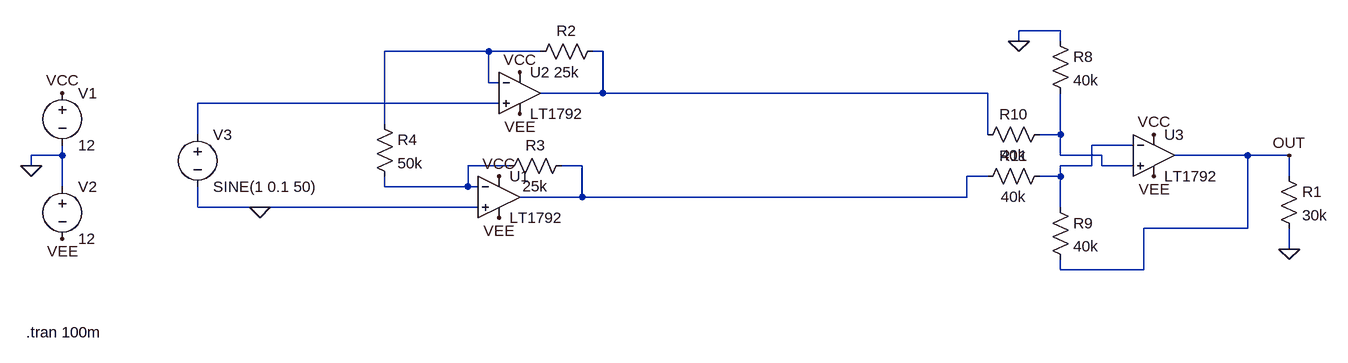
[diagram p0: schematic instrumentation_amplifier.asc]
instrumentation_amplifier.asc, the LTspice schematic file:
Version 4
SHEET 1 1684 680
WIRE 1088 -48 1024 -48
WIRE 1024 -32 1024 -48
WIRE 1088 -32 1088 -48
WIRE 208 -16 48 -16
WIRE 288 -16 208 -16
WIRE 384 -16 368 -16
WIRE 208 32 208 -16
WIRE 224 32 208 32
WIRE 384 48 384 -16
WIRE 384 48 288 48
WIRE 976 48 384 48
WIRE 224 64 -240 64
WIRE 48 96 48 -16
WIRE -240 112 -240 64
WIRE 976 112 976 48
WIRE 1088 112 1088 48
WIRE 1088 112 1056 112
WIRE 1200 128 1136 128
WIRE -448 144 -448 128
WIRE -448 144 -496 144
WIRE 1088 144 1088 112
WIRE 1152 144 1088 144
WIRE 1376 144 1264 144
WIRE 1440 144 1376 144
WIRE -496 160 -496 144
WIRE 240 160 176 160
WIRE 352 160 320 160
WIRE 1136 160 1136 128
WIRE 1136 160 1088 160
WIRE 1152 160 1152 144
WIRE 1200 160 1152 160
WIRE 976 176 944 176
WIRE 1088 176 1088 160
WIRE 1088 176 1056 176
WIRE 1440 176 1440 144
WIRE -448 192 -448 144
WIRE 48 192 48 176
WIRE 176 192 176 160
WIRE 176 192 48 192
WIRE 192 192 176 192
WIRE 352 208 352 160
WIRE 352 208 256 208
WIRE 944 208 944 176
WIRE 944 208 352 208
WIRE -240 224 -240 192
WIRE -144 224 -240 224
WIRE 192 224 -144 224
WIRE 1088 224 1088 176
WIRE 1376 256 1376 144
WIRE 1376 256 1216 256
WIRE 1440 288 1440 256
WIRE 1088 320 1088 304
WIRE 1216 320 1216 256
WIRE 1216 320 1088 320
FLAG -496 160 0
FLAG -448 48 VCC
FLAG -448 272 VEE
FLAG 1232 112 VCC
FLAG 1232 176 VEE
FLAG 1440 288 0
FLAG 1024 -32 0
FLAG 1440 144 OUT
FLAG 256 16 VCC
FLAG 224 176 VCC
FLAG 224 240 VEE
FLAG 256 80 VEE
FLAG -144 224 0
SYMBOL voltage -448 32 R0
WINDOW 123 0 0 Left 2
WINDOW 39 0 0 Left 2
SYMATTR InstName V1
SYMATTR Value 12
SYMBOL voltage -448 176 R0
WINDOW 123 0 0 Left 2
WINDOW 39 0 0 Left 2
SYMATTR InstName V2
SYMATTR Value 12
SYMBOL res 1424 160 R0
SYMATTR InstName R1
SYMATTR Value 30k
SYMBOL res 32 80 R0
SYMATTR InstName R4
SYMATTR Value 50k
SYMBOL res 1072 -48 R0
SYMATTR InstName R8
SYMATTR Value 40k
SYMBOL res 1072 208 R0
SYMATTR InstName R9
SYMATTR Value 40k
SYMBOL res 1072 96 R90
WINDOW 0 0 56 VBottom 2
WINDOW 3 32 56 VTop 2
SYMATTR InstName R10
SYMATTR Value 40k
SYMBOL res 1072 160 R90
WINDOW 0 0 56 VBottom 2
WINDOW 3 32 56 VTop 2
SYMATTR InstName R11
SYMATTR Value 40k
SYMBOL voltage -240 96 R0
WINDOW 123 0 0 Left 2
WINDOW 39 0 0 Left 2
SYMATTR InstName V3
SYMATTR Value SINE(1 0.1 50)
SYMBOL Opamps\\LT1792 224 144 R0
SYMATTR InstName U1
SYMBOL Opamps\\LT1792 256 -16 R0
SYMATTR InstName U2
SYMBOL Opamps\\LT1792 1232 80 R0
SYMATTR InstName U3
SYMBOL res 384 -32 R90
WINDOW 0 0 56 VBottom 2
WINDOW 3 32 56 VTop 2
SYMATTR InstName R2
SYMATTR Value 25k
SYMBOL res 336 144 R90
WINDOW 0 0 56 VBottom 2
WINDOW 3 32 56 VTop 2
SYMATTR InstName R3
SYMATTR Value 25k
TEXT -504 416 Left 2 !.tran 100m

The netlist it stands for:
* instrumentation_amplifier.asc
V1 VCC 0 12
V2 0 VEE 12
R1 OUT 0 30k
R4 N001 N006 50k
R8 0 N004 40k
R9 N005 OUT 40k
R10 N004 N002 40k
R11 N005 N007 40k
V3 N003 0 SINE(1 0.1 50)
XU1 0 N006 VCC VEE N007 LT1792  ; pins In+ In- V+ V- OUT
XU2 N003 N001 VCC VEE N002 LT1792  ; pins In+ In- V+ V- OUT
XU3 N004 N005 VCC VEE OUT LT1792  ; pins In+ In- V+ V- OUT
R2 N002 N001 25k
R3 N007 N006 25k
.tran 100m
.backanno
.end